# Altium project PCB_Project2.PrjPCB (part 1 of 2)
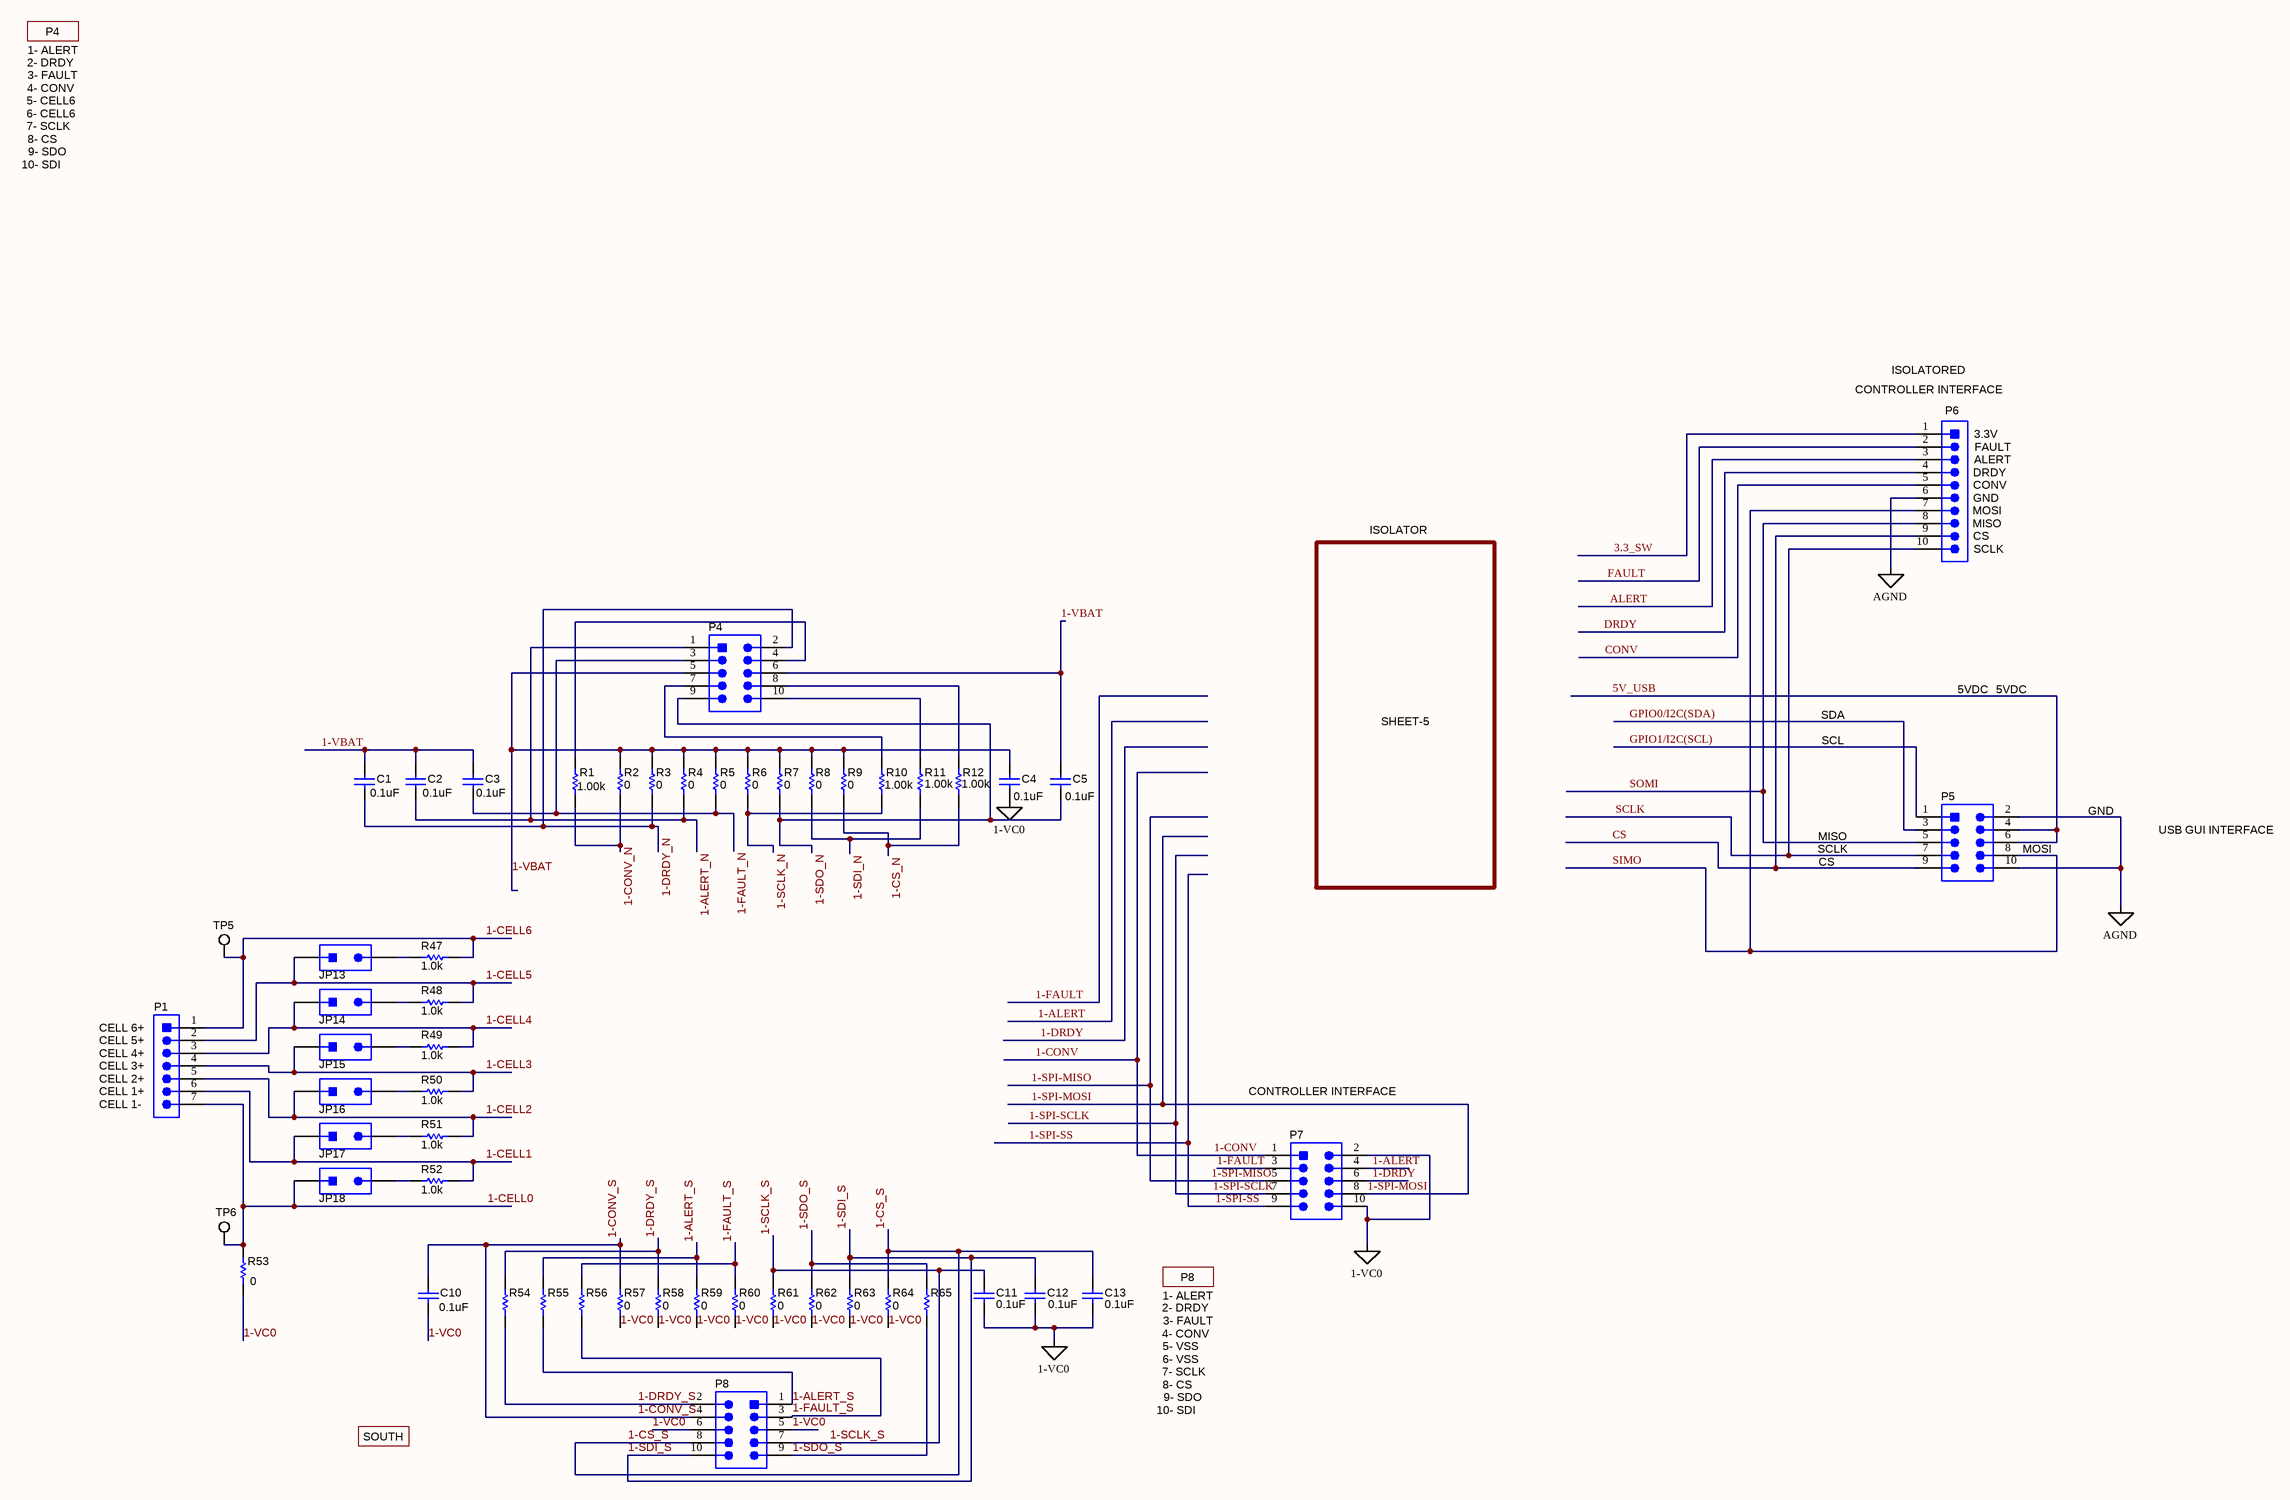
[diagram p0: Sheet1.SchDoc]
4 sheets, 255 parts. Net scope: global (net labels, ports and power ports of the same name join across sheets).
Board file: PCB2.PcbDoc
Sheets:
  Sheet1.SchDoc
  Sheet2.SchDoc
  Sheet5.SchDoc
  Sheet_hardware.SchDoc

## Sheet Sheet1.SchDoc
size A2

### Parts
C1  value 0.1uF  [0603[]]  (hidden comment: 06035C104KAT2A)
C2  value 0.1uF  [0603[]]  (hidden comment: 06035C104KAT2A)
C3  value 0.1uF  [0603[]]  (hidden comment: 06035C104KAT2A)
C4  value 0.1uF  [0603[]]  (hidden comment: 06035C104KAT2A)
C5  value 0.1uF  [0603[]]  (hidden comment: 06035C104KAT2A)
C10  value 0.1uF  [0603[]]  (hidden comment: 06035C104KAT2A)
C11  value 0.1uF  [0603[]]  (hidden comment: 06035C104KAT2A)
C12  value 0.1uF  [0603[]]  (hidden comment: 06035C104KAT2A)
C13  value 0.1uF  [0603[]]  (hidden comment: 06035C104KAT2A)
JP13  PEC02SAAN  [CONN_PEC02SAAN]  (value not drawn)
JP14  PEC02SAAN  [CONN_PEC02SAAN]  (value not drawn)
JP15  PEC02SAAN  [CONN_PEC02SAAN]  (value not drawn)
JP16  PEC02SAAN  [CONN_PEC02SAAN]  (value not drawn)
JP17  PEC02SAAN  [CONN_PEC02SAAN]  (value not drawn)
JP18  PEC02SAAN  [CONN_PEC02SAAN]  (value not drawn)
P1  395021007  [Molex_395021007]  (value not drawn)
P4  5103308-1  [CONN_5103308-1]  (value not drawn)
P5  5103308-1  [CONN_5103308-1]  (value not drawn)
P6  HPM-10-05-T-S  [Samtec_HPM-10-05-T-S]  (value not drawn)
P7  5103308-1  [CONN_5103308-1]  (value not drawn)
P8  5103308-1  [CONN_5103308-1]  (value not drawn)
R1  value 1.00k  [1206[]]  (hidden comment: CRCW12061K00FKEA)
R2  ValueDisplayed: 0  [0603[]]  (hidden comment: CRCW06030000Z0EA)
R3  ValueDisplayed: 0  [0603[]]  (hidden comment: CRCW06030000Z0EA)
R4  ValueDisplayed: 0  [0603[]]  (hidden comment: CRCW06030000Z0EA)
R5  ValueDisplayed: 0  [0603[]]  (hidden comment: CRCW06030000Z0EA)
R6  ValueDisplayed: 0  [0603[]]  (hidden comment: CRCW06030000Z0EA)
R7  ValueDisplayed: 0  [0603[]]  (hidden comment: CRCW06030000Z0EA)
R8  ValueDisplayed: 0  [0603[]]  (hidden comment: CRCW06030000Z0EA)
R9  ValueDisplayed: 0  [0603[]]  (hidden comment: CRCW06030000Z0EA)
R10  value 1.00k  [1206[]]  (hidden comment: CRCW12061K00FKEA)
R11  value 1.00k  [1206[]]  (hidden comment: CRCW12061K00FKEA)
R12  value 1.00k  [1206[]]  (hidden comment: CRCW12061K00FKEA)
R47  ValueDisplayed: 1.0k  [0603[]]  (hidden comment: CRCW06031K00JNEA)
R48  ValueDisplayed: 1.0k  [0603[]]  (hidden comment: CRCW06031K00JNEA)
R49  ValueDisplayed: 1.0k  [0603[]]  (hidden comment: CRCW06031K00JNEA)
R50  ValueDisplayed: 1.0k  [0603[]]  (hidden comment: CRCW06031K00JNEA)
R51  ValueDisplayed: 1.0k  [0603[]]  (hidden comment: CRCW06031K00JNEA)
R52  ValueDisplayed: 1.0k  [0603[]]  (hidden comment: CRCW06031K00JNEA)
R53  ValueDisplayed: 0  [1206[]]  (hidden comment: CRCW12060000Z0EA)
R54  CRCW12061K00FKEA  [1206[]]  (value not drawn)
R55  CRCW12061K00FKEA  [1206[]]  (value not drawn)
R56  CRCW12061K00FKEA  [1206[]]  (value not drawn)
R57  ValueDisplayed: 0  [0603[]]  (hidden comment: CRCW06031K00JNEA)
R58  ValueDisplayed: 0  [0603[]]  (hidden comment: CRCW06031K00JNEA)
R59  ValueDisplayed: 0  [0603[]]  (hidden comment: CRCW06031K00JNEA)
R60  ValueDisplayed: 0  [0603[]]  (hidden comment: CRCW06031K00JNEA)
R61  ValueDisplayed: 0  [0603[]]  (hidden comment: CRCW06031K00JNEA)
R62  ValueDisplayed: 0  [0603[]]  (hidden comment: CRCW06031K00JNEA)
R63  ValueDisplayed: 0  [0603[]]  (hidden comment: CRCW06031K00JNEA)
R64  ValueDisplayed: 0  [0603[]]  (hidden comment: CRCW06031K00JNEA)
R65  CRCW12061K00FKEA  [1206[]]  (value not drawn)
TP5  5015  [Testpoint_Keystone_Miniature]  (value not drawn)
TP6  5015  [Testpoint_Keystone_Miniature]  (value not drawn)

### Nets
1-CELL0: C4.2 C10.2 C11.2 C12.2 C13.2 JP18.1 P1.7 P7.2 P7.10 P8.5 P8.6 R53.1 R53.2 R57.1 R58.1 R59.1 R60.1 R61.1 R62.1 R63.1 R64.1 TP6.1  [also labelled 1-VC0]
AGND: P5.2 P5.10 P6.6
1-ALERT: P7.4
1-ALERT_N: C2.2 P4.1 R4.1
1-ALERT_S: P8.1 R55.1 R55.2 R59.2
1-CELL1: JP17.1 P1.6 R52.2
1-CELL2: JP16.1 P1.5 R51.2
1-CELL3: JP15.1 P1.4 R50.2
1-CELL4: JP14.1 P1.3 R49.2
1-CELL5: JP13.1 P1.2 R48.2
1-CELL6: P1.1 R47.2 TP5.1
1-CONV: P7.1
1-CONV_N: R1.1 R2.1
1-CONV_S: C10.1 P8.4 R57.2
1-CS_N: R9.1 R12.1
1-CS_S: C13.1 P8.8 R64.2
1-DRDY: P7.6
1-DRDY_N: C1.2 P4.2 R3.1
1-DRDY_S: P8.2 R54.1 R54.2 R58.2
1-FAULT: P7.3
1-FAULT_N: C3.2 P4.3 R5.1
1-FAULT_S: P8.3 R56.1 R56.2 R60.2
1-SCLK_N: R6.1 R10.1
1-SCLK_S: C11.1 P8.7 R61.2
1-SDI_N: R8.1 R11.1
1-SDI_S: C12.1 P8.10 R63.2
1-SDO_N: C5.2 P4.9 R7.1
1-SDO_S: P8.9 R62.2 R65.1 R65.2
1-SPI-MISO: P7.5
1-SPI-MOSI: P7.8
1-SPI-SCLK: P7.7
1-SPI-SS: P7.9
1-VBAT: C1.1 C2.1 C3.1 C4.1 C5.1 P4.5 P4.6 R2.2 R3.2 R4.2 R5.2 R6.2 R7.2 R8.2 R9.2
3.3_SW: P6.1
5V_USB: P5.4 P5.6
ALERT: P6.3
CONV: P6.5
CS: P5.9 P6.9
DRDY: P6.4
FAULT: P6.2
GPIO0/I2C(SDA): P5.3
GPIO1/I2C(SCL): P5.1
SCLK: P5.7 P6.10
SIMO: P5.8 P6.7
SOMI: P5.5 P6.8
NetJP13_2: JP13.2 R47.1
NetJP14_2: JP14.2 R48.1
NetJP15_2: JP15.2 R49.1
NetJP16_2: JP16.2 R50.1
NetJP17_2: JP17.2 R51.1
NetJP18_2: JP18.2 R52.1
NetP4_4: P4.4 R1.2
NetP4_7: P4.7 R10.2
NetP4_8: P4.8 R12.2
NetP4_10: P4.10 R11.2

### Notes on the sheet
- 2- DRDY
- 1- ALERT
- P4
- 7- SCLK
- 4- CONV
- 5- CELL6
- 6- CELL6
- 3- FAULT
- 10- SDI
- 8- CS
- 9- SDO
- ISOLATORED
- (near P6) CONTROLLER INTERFACE
- (near P6) 3.3V
- (near P6) FAULT
- (near P6) GND
- (near P6) DRDY
- (near P6) CONV
- (near P6) ALERT
- ISOLATOR
- (near P6) CS
- (near P6) MOSI
- (near P6) MISO
- (near P6) SCLK
- 5VDC
- SHEET-5
- SCL
- SDA
- GND
- USB GUI INTERFACE
- CS
- SCLK
- MISO
- (near P5) MOSI
- (near P1) CELL 2+
- (near P1) CELL 3+
- (near P1) CELL 4+
- (near P1) CELL 5+
- (near P1) CELL 6+
- (near P1) CELL 1-
- (near P1) CELL 1+
- CONTROLLER INTERFACE
- P8
- 5- VSS
- 6- VSS
- SOUTH

### Library data of the parts
C1-C5 C10-C13 = 06035C104KAT2A: CAP, CERM, 0.1 µF, 50 V, +/- 10%, X7R, 0603; Manufacturer: AVX; Polarized: N; CompType: Capacitor; ValueDisplayed: 0.1µF; U/M: EA; Cap_F: 0.0000001; Tolerance_%: 10; Value1: Unknown; VDC_V: 50; Value2: 50V; TaMin_C: -55; TaMax_C: 125; Cap_Case: 0603; SymbolVersion: 2008-07-09; PartNumber: 06035C104KAT2A; PackageReference: 0603; RoHS: Y; MountType: SMT; Technology: Ceramic; TempCo: X7R; Published: 2008-06-19; Publisher: Texas Instruments; LatestRevisionDate: 2015-07-09; ComponentLink1Description: Datasheet link; ComponentLink1URL: http://www.avx.com/docs/Catalogs/cx7r.pdf; Supplier 1: Digi-Key; Supplier Part Number 1: 478-5052-1-ND; Supplier 2: Mouser; Supplier Part Number 2: 581-06035C104KAT2A; Supplier 3: Farnell; Supplier Part Number 3: 1301804
JP13-JP18 = PEC02SAAN: Header, 100mil, 2x1, Tin, TH; Manufacturer: Sullins Connector Solutions; SymbolCreator: a0412235; U/M: EA; SymbolVersion: 2013-10-31; PartNumber: PEC02SAAN; ClassName: Header; PackageReference: Header, 2 PIN, 100mil, Tin; CompType: Header; RoHS: Y; MountType: TH; ComponentLink1Description: Datasheet Link; ComponentLink1URL: http://www.sullinscorp.com/catalogs/97_Page78-79_HEADER_.100_2.54mm_MALE_BREAKAWAY.pdf; Publisher: Texas Instruments; LatestRevisionDate: 2014-11-19; Supplier 1: Digi-Key; Supplier Part Number 1: S1012E-02-ND
P1 = 395021007: Header(Shrouded), 3.5mm, 7x1,  R/A, TH; Manufacturer: Molex; SymbolCreator: a0411947; U/M: EA; SymbolVersion: 2013-12-22; PartNumber: 395021007; PackageReference: Header(Shrouded), 3.5mm, 7x1, R/A, TH; CompType: Header; RoHS: Y; MountType: TH; ComponentLink1Description: Datasheet Link; ComponentLink1URL: http://www.molex.com/pdm_docs/sd/395021002_sd.pdf; Publisher: Texas Instruments; LatestRevisionDate: 2015-06-30; Supplier 1: Digi-Key; Supplier Part Number 1: WM7775-ND; Supplier 2: Mouser; Supplier Part Number 2: 538-39502-1007
P4 P5 P7 P8 = 5103308-1: Header (shrouded), 100mil, 5x2, Gold, TH; Manufacturer: TE Connectivity; SymbolCreator: a0412235; U/M: EA; SymbolVersion: 2013-12-22; PartNumber: 5103308-1; PackageReference: 5x2 Shrouded header; CompType: Header; RoHS: Y; MountType: TH; ComponentLink1Description: Datasheet Link; ComponentLink1URL: http://www.te.com/commerce/DocumentDelivery/DDEController?Action=showdoc&DocId=Customer+Drawing%7F5103308%7FE%7Fpdf%7FEnglish%7FENG_CD_5103308_E.pdf%7F5103308-1; Publisher: Texas Instruments; LatestRevisionDate: 2014-11-19; Supplier 1: Digi-Key; Supplier Part Number 1: A33159-ND; Supplier 2: Mouser; Supplier Part Number 2: 571-5103308-1; Supplier 3: Farnell; Supplier Part Number 3: 1772835
P6 = HPM-10-05-T-S: Header, 5.08mm, 10x1, Tin, TH; Manufacturer: Samtec; SymbolCreator: a0412235; U/M: EA; SymbolVersion: 2013-12-22; PartNumber: HPM-10-05-T-S; PackageReference: Header, 5.08mm, 10x1, TH; ClassName: Header; CompType: Header; RoHS: Y; MountType: TH; ComponentLink1Description: Datasheet Link; ComponentLink1URL: https://www.samtec.com/ftppub/pdf/HPM.PDF; Publisher: Texas Instruments; LatestRevisionDate: 2015-08-24; Supplier 1: Digi-Key; Supplier Part Number 1: HPM-10-05-T-S-ND
R1 R10-R12 = CRCW12061K00FKEA: RES, 1.00 k, 1%, 0.25 W, 1206; Manufacturer: Vishay-Dale; CompType: Resistor; Res_ohm: 1000; Value_Code: 1k00; Tolerance_%: 1; Power_W: 0.25; Value2: 0.25W; VDC_V: 200; TempCo: 100 ppm/C; EIA_Code: E96; U/M: EA; SymbolVersion: 2009-05-29; PartNumber: CRCW12061K00FKEA; PackageReference: 1206; RoHS: Y; Value1: 1%; MountType: SMT; Technology: Thick Film; Published: 2008-06-26; Publisher: Texas Instruments; LatestRevisionDate: 2015-06-11; ComponentLink1Description: Datasheet link; ComponentLink1URL: http://www.vishay.com/docs/20035/dcrcwe3.pdf; Supplier 1: Digi-Key; Supplier Part Number 1: 541-1.00KFCT-ND; Supplier 2: Mouser; Supplier Part Number 2: 71-CRCW1206-1.0K-E3; Supplier 3: Farnell; Supplier Part Number 3: 1469965; ValueDisplayed: 1.00k
R2-R9 = CRCW06030000Z0EA: RES, 0, 5%, 0.1 W, 0603; Manufacturer: Vishay-Dale; CompType: Resistor; Value: 0; Value_Code: 0000; Tolerance_%: 5; Power_W: 0.1; Value2: 0.1W; VDC_V: 75; TempCo: 200 ppm/C; EIA_Code: E24; U/M: EA; SymbolVersion: 2009-05-29; PartNumber: CRCW06030000Z0EA; PackageReference: 0603; RoHS: Y; Res_ohm: 0; Value1: 5%; MountType: SMT; Technology: Thick Film; Published: 2008-06-26; Publisher: Texas Instruments; LatestRevisionDate: 2015-06-13; ComponentLink1Description: Datasheet link; ComponentLink1URL: http://www.vishay.com/docs/20035/dcrcwe3.pdf; Supplier 1: Digi-Key; Supplier Part Number 1: 541-0.0GCT-ND; Supplier 2: Mouser; Supplier Part Number 2: 71-CRCW0603-0-E3; Supplier 3: Farnell; Supplier Part Number 3: 1469739
R47-R52 R57-R64 = CRCW06031K00JNEA: RES, 1.0 k, 5%, 0.1 W, 0603; Manufacturer: Vishay-Dale; CompType: Resistor; Value: 1.0k; Res_ohm: 1000; Value_Code: 1k00; Tolerance_%: 5; Power_W: 0.1; Value2: 0.1W; VDC_V: 75; TempCo: 200 ppm/C; EIA_Code: E24; U/M: EA; SymbolVersion: 2009-05-29; PartNumber: CRCW06031K00JNEA; PackageReference: 0603; RoHS: Y; Value1: 5%; MountType: SMT; Technology: Thick Film; Published: 2008-06-26; Publisher: Texas Instruments; LatestRevisionDate: 2015-06-13; ComponentLink1Description: Datasheet link; ComponentLink1URL: http://www.vishay.com/docs/20035/dcrcwe3.pdf; Supplier 1: Digi-Key; Supplier Part Number 1: 541-1.0KGCT-ND; Supplier 2: Mouser; Supplier Part Number 2: 71-CRCW0603J-1.0K-E3; Supplier 3: Farnell; Supplier Part Number 3: 1652851
R53 = CRCW12060000Z0EA: RES, 0, 5%, 0.25 W, 1206; Manufacturer: Vishay-Dale; CompType: Resistor; Value: 0; Value_Code: 0000; Tolerance_%: 5; Power_W: 0.25; Value2: 0.25W; VDC_V: 200; TempCo: 200 ppm/C; EIA_Code: E24; U/M: EA; SymbolVersion: 2009-05-29; PartNumber: CRCW12060000Z0EA; PackageReference: 1206; RoHS: Y; Res_ohm: 0; Value1: 5%; MountType: SMT; Technology: Thick Film; Published: 2008-06-26; Publisher: Texas Instruments; LatestRevisionDate: 2015-06-11; ComponentLink1Description: Datasheet link; ComponentLink1URL: http://www.vishay.com/docs/20035/dcrcwe3.pdf; Supplier 1: Digi-Key; Supplier Part Number 1: 541-0.0ECT-ND; Supplier 2: Mouser; Supplier Part Number 2: 71-CRCW1206-0-E3; Supplier 3: Farnell; Supplier Part Number 3: 1469963
R54-R56 R65 = CRCW12061K00FKEA: RES, 1.00 k, 1%, 0.25 W, 1206; Manufacturer: Vishay-Dale; CompType: Resistor; Value: 1.00k; Res_ohm: 1000; Value_Code: 1k00; Tolerance_%: 1; Power_W: 0.25; Value2: 0.25W; VDC_V: 200; TempCo: 100 ppm/C; EIA_Code: E96; U/M: EA; SymbolVersion: 2009-05-29; PartNumber: CRCW12061K00FKEA; PackageReference: 1206; RoHS: Y; Value1: 1%; MountType: SMT; Technology: Thick Film; Published: 2008-06-26; Publisher: Texas Instruments; LatestRevisionDate: 2015-06-11; ComponentLink1Description: Datasheet link; ComponentLink1URL: http://www.vishay.com/docs/20035/dcrcwe3.pdf; Supplier 1: Digi-Key; Supplier Part Number 1: 541-1.00KFCT-ND; Supplier 2: Mouser; Supplier Part Number 2: 71-CRCW1206-1.0K-E3; Supplier 3: Farnell; Supplier Part Number 3: 1469965; ValueDisplayed: 1.00k
TP5 TP6 = 5015: Test Point, Miniature, SMT; Manufacturer: Keystone; CompType: Test Point Loop; U/M: EA; SymbolVersion: 2008-07-10; PackageReference: Testpoint_Keystone_Miniature; Publisher: Texas Instruments; LatestRevisionDate: 2015-07-28; PartNumber: 5015; RoHS: Y; MountType: SMT; ComponentLink1Description: Datasheet Link; ComponentLink1URL: http://www.keyelco.com/userAssets/store/files/5015.PDF; Value: SMT; Supplier 1: Digi-Key; Supplier Part Number 1: 36-5015CT-ND

## Sheet Sheet2.SchDoc
size A2
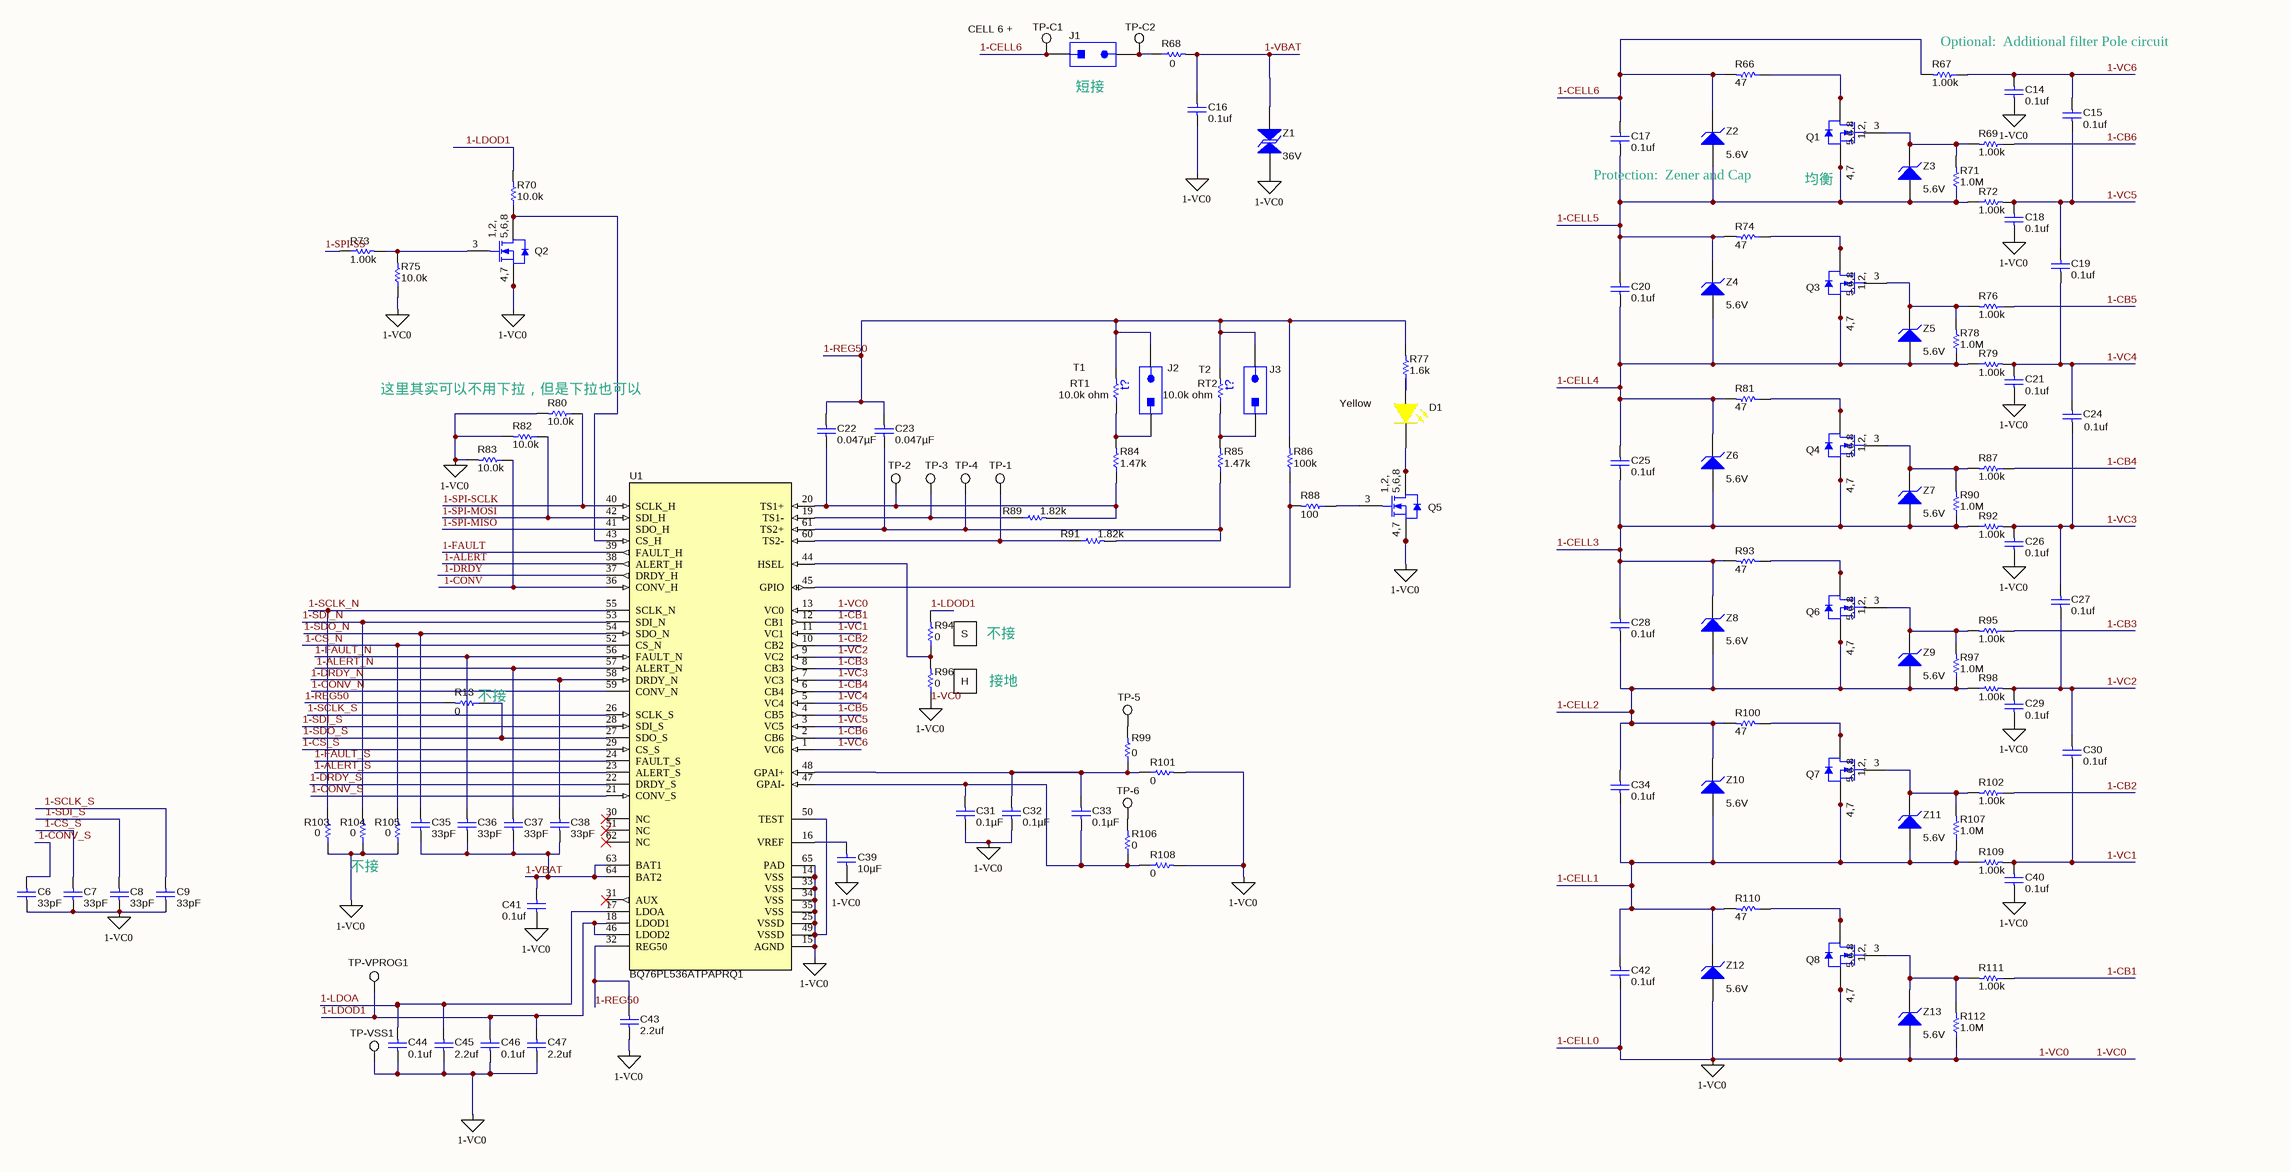
[diagram p1: Sheet2.SchDoc]

### Parts
C6  ValueDisplayed: 33pF  [0603[]]  (hidden comment: GRM1885C1H330JA01D)
C7  ValueDisplayed: 33pF  [0603[]]  (hidden comment: GRM1885C1H330JA01D)
C8  ValueDisplayed: 33pF  [0603[]]  (hidden comment: GRM1885C1H330JA01D)
C9  ValueDisplayed: 33pF  [0603[]]  (hidden comment: GRM1885C1H330JA01D)
C14  ValueDisplayed: 0.1uf  [0603[]]  (hidden comment: 06035C104KAT2A)
C15  ValueDisplayed: 0.1uf  [0603[]]  (hidden comment: GRM188R72A104KA35D)
C16  ValueDisplayed: 0.1uf  [0603[]]  (hidden comment: GRM188R72A104KA35D)
C17  ValueDisplayed: 0.1uf  [0603[]]  (hidden comment: 06035C104KAT2A)
C18  ValueDisplayed: 0.1uf  [0603[]]  (hidden comment: 06035C104KAT2A)
C19  ValueDisplayed: 0.1uf  [0603[]]  (hidden comment: GRM188R72A104KA35D)
C20  ValueDisplayed: 0.1uf  [0603[]]  (hidden comment: 06035C104KAT2A)
C21  ValueDisplayed: 0.1uf  [0603[]]  (hidden comment: 06035C104KAT2A)
C22  ValueDisplayed: 0.047µF  [0603[]]  (hidden comment: GRM188R71C473KA01D)
C23  ValueDisplayed: 0.047µF  [0603[]]  (hidden comment: GRM188R71C473KA01D)
C24  ValueDisplayed: 0.1uf  [0603[]]  (hidden comment: GRM188R72A104KA35D)
C25  ValueDisplayed: 0.1uf  [0603[]]  (hidden comment: 06035C104KAT2A)
C26  ValueDisplayed: 0.1uf  [0603[]]  (hidden comment: 06035C104KAT2A)
C27  ValueDisplayed: 0.1uf  [0603[]]  (hidden comment: GRM188R72A104KA35D)
C28  ValueDisplayed: 0.1uf  [0603[]]  (hidden comment: 06035C104KAT2A)
C29  ValueDisplayed: 0.1uf  [0603[]]  (hidden comment: 06035C104KAT2A)
C30  ValueDisplayed: 0.1uf  [0603[]]  (hidden comment: GRM188R72A104KA35D)
C31  ValueDisplayed: 0.1µF  [0603[]]  (hidden comment: C0603C104K4RACTU)
C32  ValueDisplayed: 0.1µF  [0603[]]  (hidden comment: C0603C104K4RACTU)
C33  ValueDisplayed: 0.1µF  [0603[]]  (hidden comment: C0603C104K4RACTU)
C34  ValueDisplayed: 0.1uf  [0603[]]  (hidden comment: GRM188R72A104KA35D)
C35  ValueDisplayed: 33pF  [0603[]]  (hidden comment: GRM1885C1H330JA01D)
C36  ValueDisplayed: 33pF  [0603[]]  (hidden comment: GRM1885C1H330JA01D)
C37  ValueDisplayed: 33pF  [0603[]]  (hidden comment: GRM1885C1H330JA01D)
C38  ValueDisplayed: 33pF  [0603[]]  (hidden comment: GRM1885C1H330JA01D)
C39  ValueDisplayed: 10µF  [0805_145]  (hidden comment: C2012X7R1A106M125AC)
C40  ValueDisplayed: 0.1uf  [0603[]]  (hidden comment: 06035C104KAT2A)
C41  ValueDisplayed: 0.1uf  [0603[]]  (hidden comment: 06035C104KAT2A)
C42  ValueDisplayed: 0.1uf  [0603[]]  (hidden comment: 06035C104KAT2A)
C43  ValueDisplayed: 2.2uf  [0805_HV]  (hidden comment: GRM21BR71A225KA01L)
C44  ValueDisplayed: 0.1uf  [0603[]]  (hidden comment: 06035C104KAT2A)
C45  ValueDisplayed: 2.2uf  [0805_HV]  (hidden comment: GRM21BR71A225KA01L)
C46  ValueDisplayed: 0.1uf  [0603[]]  (hidden comment: 06035C104KAT2A)
C47  ValueDisplayed: 2.2uf  [0805_HV]  (hidden comment: GRM21BR71A225KA01L)
D1  value Yellow  [APT1608_Yellow]  (hidden comment: APT1608SYCK)
J1  PEC02SAAN  [CONN_PEC02SAAN]  (value not drawn)
J2  PEC02SAAN  [CONN_PEC02SAAN]  (value not drawn)
J3  PEC02SAAN  [CONN_PEC02SAAN]  (value not drawn)
Q1  CSD16301Q2  [TRANS_NexFET_Q2]  (value not drawn)
Q2  CSD16301Q2  [TRANS_NexFET_Q2]  (value not drawn)
Q3  CSD16301Q2  [TRANS_NexFET_Q2]  (value not drawn)
Q4  CSD16301Q2  [TRANS_NexFET_Q2]  (value not drawn)
Q5  CSD16301Q2  [TRANS_NexFET_Q2]  (value not drawn)
Q6  CSD16301Q2  [TRANS_NexFET_Q2]  (value not drawn)
Q7  CSD16301Q2  [TRANS_NexFET_Q2]  (value not drawn)
Q8  CSD16301Q2  [TRANS_NexFET_Q2]  (value not drawn)
R13  ValueDisplayed: 0  [0603[]]  (hidden comment: CRCW06030000Z0EA)
R66  ValueDisplayed: 47  [2512]  (hidden comment: CRCW251247R0JNEG)
R67  ValueDisplayed: 1.00k  [0603[]]  (hidden comment: RG1608P-102-B-T5)
R68  ValueDisplayed: 0  [0805_HV]  (hidden comment: CRCW08050000Z0EA)
R69  ValueDisplayed: 1.00k  [0603[]]  (hidden comment: RG1608P-102-B-T5)
R70  ValueDisplayed: 10.0k  [0603[]]  (hidden comment: ERJ-3EKF1002V)
R71  ValueDisplayed: 1.0M  [0603[]]  (hidden comment: CRCW06031M00JNEA)
R72  ValueDisplayed: 1.00k  [0603[]]  (hidden comment: RG1608P-102-B-T5)
R73  ValueDisplayed: 1.00k  [0603[]]  (hidden comment: RG1608P-102-B-T5)
R74  ValueDisplayed: 47  [2512]  (hidden comment: CRCW251247R0JNEG)
R75  ValueDisplayed: 10.0k  [0603[]]  (hidden comment: ERJ-3EKF1002V)
R76  ValueDisplayed: 1.00k  [0603[]]  (hidden comment: RG1608P-102-B-T5)
R77  ValueDisplayed: 1.6k  [0603[]]  (hidden comment: CRCW06031K60JNEA)
R78  ValueDisplayed: 1.0M  [0603[]]  (hidden comment: CRCW06031M00JNEA)
R79  ValueDisplayed: 1.00k  [0603[]]  (hidden comment: RG1608P-102-B-T5)
R80  ValueDisplayed: 10.0k  [0603[]]  (hidden comment: ERJ-3EKF1002V)
R81  ValueDisplayed: 47  [2512]  (hidden comment: CRCW251247R0JNEG)
R82  ValueDisplayed: 10.0k  [0603[]]  (hidden comment: ERJ-3EKF1002V)
R83  ValueDisplayed: 10.0k  [0603[]]  (hidden comment: ERJ-3EKF1002V)
R84  ValueDisplayed: 1.47k  [0603[]]  (hidden comment: CRCW06031K47FKEA)
R85  ValueDisplayed: 1.47k  [0603[]]  (hidden comment: CRCW06031K47FKEA)
R86  ValueDisplayed: 100k  [0603[]]  (hidden comment: CRCW0603100KFKEA)
R87  ValueDisplayed: 1.00k  [0603[]]  (hidden comment: RG1608P-102-B-T5)
R88  ValueDisplayed: 100  [0603[]]  (hidden comment: CRCW0603100RJNEA)
R89  ValueDisplayed: 1.82k  [0603[]]  (hidden comment: CRCW06031K82FKEA)
R90  ValueDisplayed: 1.0M  [0603[]]  (hidden comment: CRCW06031M00JNEA)
R91  ValueDisplayed: 1.82k  [0603[]]  (hidden comment: CRCW06031K82FKEA)
R92  ValueDisplayed: 1.00k  [0603[]]  (hidden comment: RG1608P-102-B-T5)
R93  ValueDisplayed: 47  [2512]  (hidden comment: CRCW251247R0JNEG)
R94  ValueDisplayed: 0  [0603[]]  (hidden comment: CRCW06030000Z0EA)
R95  ValueDisplayed: 1.00k  [0603[]]  (hidden comment: RG1608P-102-B-T5)
R96  ValueDisplayed: 0  [0603[]]  (hidden comment: CRCW06030000Z0EA)
R97  ValueDisplayed: 1.0M  [0603[]]  (hidden comment: CRCW06031M00JNEA)
R98  ValueDisplayed: 1.00k  [0603[]]  (hidden comment: RG1608P-102-B-T5)
R99  ValueDisplayed: 0  [0603[]]  (hidden comment: CRCW06030000Z0EA)
R100  ValueDisplayed: 47  [2512]  (hidden comment: CRCW251247R0JNEG)
R101  ValueDisplayed: 0  [0603[]]  (hidden comment: CRCW06030000Z0EA)
R102  ValueDisplayed: 1.00k  [0603[]]  (hidden comment: RG1608P-102-B-T5)
R103  ValueDisplayed: 0  [0603[]]  (hidden comment: CRCW06030000Z0EA)
R104  ValueDisplayed: 0  [0603[]]  (hidden comment: CRCW06030000Z0EA)
R105  ValueDisplayed: 0  [0603[]]  (hidden comment: CRCW06030000Z0EA)
R106  ValueDisplayed: 0  [0603[]]  (hidden comment: CRCW06030000Z0EA)
R107  ValueDisplayed: 1.0M  [0603[]]  (hidden comment: CRCW06031M00JNEA)
R108  ValueDisplayed: 0  [0603[]]  (hidden comment: CRCW06030000Z0EA)
R109  ValueDisplayed: 1.00k  [0603[]]  (hidden comment: RG1608P-102-B-T5)
R110  ValueDisplayed: 47  [2512]  (hidden comment: CRCW251247R0JNEG)
R111  ValueDisplayed: 1.00k  [0603[]]  (hidden comment: RG1608P-102-B-T5)
R112  ValueDisplayed: 1.0M  [0603[]]  (hidden comment: CRCW06031M00JNEA)
RT1  value 10.0k ohm  [0603[]]  (hidden comment: ERT-J1VG103FA)
RT2  value 10.0k ohm  [0603[]]  (hidden comment: ERT-J1VG103FA)
TP-1  5015  [Testpoint_Keystone_Miniature]  (value not drawn)
TP-2  5015  [Testpoint_Keystone_Miniature]  (value not drawn)
TP-3  5015  [Testpoint_Keystone_Miniature]  (value not drawn)
TP-4  5015  [Testpoint_Keystone_Miniature]  (value not drawn)
TP-5  5015  [Testpoint_Keystone_Miniature]  (value not drawn)
TP-6  5015  [Testpoint_Keystone_Miniature]  (value not drawn)
TP-C1  5015  [Testpoint_Keystone_Miniature]  (value not drawn)
TP-C2  5015  [Testpoint_Keystone_Miniature]  (value not drawn)
TP-VPROG1  5015  [Testpoint_Keystone_Miniature]  (value not drawn)
TP-VSS1  5015  [Testpoint_Keystone_Miniature]  (value not drawn)
U1  BQ76PL536ATPAPRQ1  [PAP0064F_N]
Z1  value 36V  [SMA]  (hidden comment: SMAJ36CA)
Z2  value 5.6V  [SOD-123]  (hidden comment: MMSZ5232B-7-F)
Z3  value 5.6V  [SOD-123]  (hidden comment: MMSZ5232B-7-F)
Z4  value 5.6V  [SOD-123]  (hidden comment: MMSZ5232B-7-F)
Z5  value 5.6V  [SOD-123]  (hidden comment: MMSZ5232B-7-F)
Z6  value 5.6V  [SOD-123]  (hidden comment: MMSZ5232B-7-F)
Z7  value 5.6V  [SOD-123]  (hidden comment: MMSZ5232B-7-F)
Z8  value 5.6V  [SOD-123]  (hidden comment: MMSZ5232B-7-F)
Z9  value 5.6V  [SOD-123]  (hidden comment: MMSZ5232B-7-F)
Z10  value 5.6V  [SOD-123]  (hidden comment: MMSZ5232B-7-F)
Z11  value 5.6V  [SOD-123]  (hidden comment: MMSZ5232B-7-F)
Z12  value 5.6V  [SOD-123]  (hidden comment: MMSZ5232B-7-F)
Z13  value 5.6V  [SOD-123]  (hidden comment: MMSZ5232B-7-F)

### Nets
1-CELL0: C6.2 C7.2 C8.2 C9.2 C14.2 C16.2 C18.2 C21.2 C26.2 C29.2 C31.2 C32.2 C39.2 C40.2 C41.2 C42.2 C43.2 C44.2 C45.2 C46.2 C47.2 Q2.4(S) Q2.7(S) Q5.4(S) Q5.7(S) Q8.4(S) Q8.7(S) R75.1 R80.2 R82.2 R83.2 R96.1 R101.2 R103.1 R104.1 R105.1 R108.2 R112.1 TP-VSS1.1 U1.13(VC0) U1.14(VSS) U1.15(AGND) U1.25(VSSD) U1.33(VSS) U1.34(VSS) U1.35(VSS) U1.49(VSSD) U1.50(TEST) U1.65(PAD) Z1.1 Z12.2(A) Z13.2(A)  [also labelled 1-VC0]
1-ALERT: U1.38(ALERT_H)
1-ALERT_N: C37.1 U1.57(ALERT_N)
1-ALERT_S: U1.23(ALERT_S)
1-CB1: R111.1 U1.12(CB1)
1-CB2: R102.1 U1.10(CB2)
1-CB3: R95.1 U1.8(CB3)
1-CB4: R87.1 U1.6(CB4)
1-CB5: R76.1 U1.4(CB5)
1-CB6: R69.1 U1.2(CB6)
1-CELL1: C34.2 C42.1 Q7.4(S) Q7.7(S) R107.1 R109.1 R110.2 Z10.2(A) Z11.2(A) Z12.1(K)
1-CELL2: C28.2 C34.1 Q6.4(S) Q6.7(S) R97.1 R98.1 R100.2 Z8.2(A) Z9.2(A) Z10.1(K)
1-CELL3: C25.2 C28.1 Q4.4(S) Q4.7(S) R90.1 R92.1 R93.2 Z6.2(A) Z7.2(A) Z8.1(K)
1-CELL4: C20.2 C25.1 Q3.4(S) Q3.7(S) R78.1 R79.1 R81.2 Z4.2(A) Z5.2(A) Z6.1(K)
1-CELL5: C17.2 C20.1 Q1.4(S) Q1.7(S) R71.1 R72.1 R74.2 Z2.2(A) Z3.2(A) Z4.1(K)
1-CELL6: C17.1 J1.1 R66.2 R67.2 TP-C1.1 Z2.1(K)
1-CONV: R83.1 U1.36(CONV_H)
1-CONV_N: U1.59(CONV_N)
1-CONV_S: C6.1 U1.21(CONV_S)
1-CS_N: R105.2 U1.52(CS_N)
1-CS_S: C7.1 U1.29(CS_S)
1-DRDY: U1.37(DRDY_H)
1-DRDY_N: C38.1 U1.58(DRDY_N)
1-DRDY_S: U1.22(DRDY_S)
1-FAULT: U1.39(FAULT_H)
1-FAULT_N: C36.1 U1.56(FAULT_N)
1-FAULT_S: U1.24(FAULT_S)
1-LDOA: C44.1 C45.1 U1.17(LDOA)
1-LDOD1: C46.1 C47.1 R70.2 R94.2 TP-VPROG1.1 U1.18(LDOD1) U1.46(LDOD2)
1-REG50: C22.1 C23.1 C43.1 J2.2 J3.2 R13.2 R77.2 R86.2 RT1.2 RT2.2 U1.32(REG50)
1-SCLK_N: R103.2 U1.55(SCLK_N)
1-SCLK_S: C9.1 U1.26(SCLK_S)
1-SDI_N: R104.2 U1.53(SDI_N)
1-SDI_S: C8.1 U1.28(SDI_S)
1-SDO_N: C35.1 U1.54(SDO_N)
1-SDO_S: R13.1 U1.27(SDO_S)
1-SPI-MISO: U1.41(SDO_H)
1-SPI-MOSI: R82.1 U1.42(SDI_H)
1-SPI-SCLK: R80.1 U1.40(SCLK_H)
1-SPI-SS: R73.1
1-VBAT: C16.1 C35.2 C36.2 C37.2 C38.2 C41.1 R68.2 U1.63(BAT1) U1.64(BAT2) Z1.2
1-VC1: C30.2 C40.1 R109.2 U1.11(VC1)
1-VC2: C27.2 C29.1 C30.1 R98.2 U1.9(VC2)
1-VC3: C24.2 C26.1 C27.1 R92.2 U1.7(VC3)
1-VC4: C19.2 C21.1 C24.1 R79.2 U1.5(VC4)
1-VC5: C15.2 C18.1 C19.1 R72.2 U1.3(VC5)
1-VC6: C14.1 C15.1 R67.1 U1.1(VC6)
NetC22_2: C22.2 R84.1 R89.2 TP-2.1 U1.20(TS1+)
NetC23_2: C23.2 R85.1 R91.2 TP-4.1 U1.61(TS2+)
NetC31_1: C31.1 C33.2 R106.1 R108.1 U1.47(GPAI-)
NetC32_1: C32.1 C33.1 R99.1 R101.1 U1.48(GPAI+)
NetC39_1: C39.1 U1.16(VREF)
NetD1_1: D1.1(A) R77.1
NetD1_2: D1.2(K) Q5.1(D) Q5.2(D) Q5.5(D) Q5.6(D) Q5.8(D)
NetJ1_2: J1.2 R68.1 TP-C2.1
NetJ2_1: J2.1 R84.2 RT1.1
NetJ3_1: J3.1 R85.2 RT2.1
NetQ1_1: Q1.1(D) Q1.2(D) Q1.5(D) Q1.6(D) Q1.8(D) R66.1
NetQ1_3: Q1.3(G) R69.2 R71.2 Z3.1(K)
NetQ2_1: Q2.1(D) Q2.2(D) Q2.5(D) Q2.6(D) Q2.8(D) R70.1 U1.43(CS_H)
NetQ2_3: Q2.3(G) R73.2 R75.2
NetQ3_1: Q3.1(D) Q3.2(D) Q3.5(D) Q3.6(D) Q3.8(D) R74.1
NetQ3_3: Q3.3(G) R76.2 R78.2 Z5.1(K)
NetQ4_1: Q4.1(D) Q4.2(D) Q4.5(D) Q4.6(D) Q4.8(D) R81.1
NetQ4_3: Q4.3(G) R87.2 R90.2 Z7.1(K)
NetQ5_3: Q5.3(G) R88.1
NetQ6_1: Q6.1(D) Q6.2(D) Q6.5(D) Q6.6(D) Q6.8(D) R93.1
NetQ6_3: Q6.3(G) R95.2 R97.2 Z9.1(K)
NetQ7_1: Q7.1(D) Q7.2(D) Q7.5(D) Q7.6(D) Q7.8(D) R100.1
NetQ7_3: Q7.3(G) R102.2 R107.2 Z11.1(K)
NetQ8_1: Q8.1(D) Q8.2(D) Q8.5(D) Q8.6(D) Q8.8(D) R110.1
NetQ8_3: Q8.3(G) R111.2 R112.2 Z13.1(K)
NetR86_1: R86.1 R88.2 U1.45(GPIO)
NetR89_1: R89.1 TP-3.1 U1.19(TS1-)
NetR91_1: R91.1 TP-1.1 U1.60(TS2-)
NetR94_1: R94.1 R96.2 U1.44(HSEL)
NetR99_2: R99.2 TP-5.1
NetR106_2: R106.2 TP-6.1

Not connected (* = marked no-connect by the designer): U1 30(NC)* 31(AUX)* 51(NC)* 62(NC)*

### Notes on the sheet
- (near TP-C1) CELL 6 +
- Optional:  Additional filter Pole circuit
- (near J1) 短接
- Protection:  Zener and Cap
- (near Q1) 均衡
- 这里其实可以不用下拉，但是下拉也可以
- (near RT1) T1
- (near RT2) T2
- S
- H
- 不接
- 接地
- (near R13) 不接
- (in symbol CSD16301Q2) 1,2,; 5,6,8; 4,7
- (in symbol ERT-J1VG103FA) t?

### Library data of the parts
C6-C9 C35-C38 = GRM1885C1H330JA01D: CAP, CERM, 33 pF, 50 V, +/- 5%, C0G/NP0, 0603; Manufacturer: MuRata; Polarized: N; CompType: Capacitor; Value: 33pF; U/M: EA; Cap_F: 0.000000000033; Tolerance_%: 5; Value1: Unknown; VDC_V: 50; Value2: 50V; TaMin_C: -55; TaMax_C: 125; Cap_Case: 0603; SymbolVersion: 2008-07-09; PartNumber: GRM1885C1H330JA01D; PackageReference: 0603; RoHS: Y; MountType: SMT; Technology: Ceramic; TempCo: C0G/NP0; Published: 2008-06-19; Publisher: Texas Instruments; LatestRevisionDate: 2015-07-09; ComponentLink1Description: Datasheet link; ComponentLink1URL: http://search.murata.co.jp/Ceramy/PnsearchViewAction.do?HnOFG=ON&HnNFG=ON&SEL_CNT=50&sLang=en&sKey=GRM1885C1H330JA01D&x=9&y=9&search=startwith; Supplier 1: Digi-Key; Supplier Part Number 1: 490-1415-1-ND; Supplier 2: Mouser; Supplier Part Number 2: 81-GRM39C330J50; Supplier 3: Farnell; Supplier Part Number 3: 1828910
C14 C17 C18 C20 C21 C25 C26 C28 C29 C40-C42 C44 C46 = 06035C104KAT2A: CAP, CERM, 0.1uf, 50 V, +/- 10%, X7R, 0603; Manufacturer: AVX; Polarized: N; CompType: Capacitor; U/M: EA; Cap_F: 0.0000001; Tolerance_%: 10; Value1: Unknown; VDC_V: 50; Value2: 50V; TaMin_C: -55; TaMax_C: 125; Cap_Case: 0603; SymbolVersion: 2008-07-09; Value: 0.1uF; PartNumber: 06035C104KAT2A; PackageReference: 0603; RoHS: Y; MountType: SMT; Technology: Ceramic; TempCo: X7R; Published: 2008-06-19; Publisher: Texas Instruments; LatestRevisionDate: 2015-07-09; ComponentLink1Description: Datasheet link; ComponentLink1URL: http://www.avx.com/docs/Catalogs/cx7r.pdf; Supplier 1: Digi-Key; Supplier Part Number 1: 478-5052-1-ND; Supplier 2: Mouser; Supplier Part Number 2: 581-06035C104KAT2A; Supplier 3: Farnell; Supplier Part Number 3: 1301804
C15 C16 C19 C24 C27 C30 C34 = GRM188R72A104KA35D: CAP, CERM, 0.1uf, 100 V, +/- 10%, X7R, 0603; Manufacturer: MuRata; Polarized: N; CompType: Capacitor; U/M: EA; Cap_F: 0.0000001; Tolerance_%: 10; Value1: Unknown; VDC_V: 100; Value2: 100V; TaMin_C: -55; TaMax_C: 125; Cap_Case: 0603; SymbolVersion: 2008-07-09; Value: 0.1uF; PartNumber: GRM188R72A104KA35D; PackageReference: 0603; RoHS: Y; MountType: SMT; Technology: Ceramic; TempCo: X7R; Published: 2008-06-19; Publisher: Texas Instruments; LatestRevisionDate: 2015-07-09; ComponentLink1Description: Datasheet link; ComponentLink1URL: http://search.murata.co.jp/Ceramy/PnsearchViewAction.do?HnOFG=ON&HnNFG=ON&SEL_CNT=50&sLang=en&sKey=GRM188R72A104KA35D&x=9&y=9&search=startwith; Supplier 1: Digi-Key; Supplier Part Number 1: 490-3285-1-ND; Supplier 2: Mouser; Supplier Part Number 2: 81-GRM188R72A104KA35; Supplier 3: Farnell; Supplier Part Number 3: 1828921
C22 C23 = GRM188R71C473KA01D: CAP, CERM, 0.047 µF, 16 V, +/- 10%, X7R, 0603; Manufacturer: MuRata; Polarized: N; CompType: Capacitor; Value: 0.047uF; U/M: EA; Cap_F: 0.000000047; Tolerance_%: 10; Value1: Unknown; VDC_V: 16; Value2: 16V; TaMin_C: -55; TaMax_C: 125; Cap_Case: 0603; SymbolVersion: 2008-07-09; PartNumber: GRM188R71C473KA01D; PackageReference: 0603; RoHS: Y; MountType: SMT; Technology: Ceramic; TempCo: X7R; Published: 2008-06-19; Publisher: Texas Instruments; LatestRevisionDate: 2015-07-09; ComponentLink1Description: Datasheet link; ComponentLink1URL: http://search.murata.co.jp/Ceramy/PnsearchViewAction.do?HnOFG=ON&HnNFG=ON&SEL_CNT=50&sLang=en&sKey=GRM188R71C473KA01D&x=9&y=9&search=startwith; Supplier 1: Digi-Key; Supplier Part Number 1: 490-1529-1-ND; Supplier 2: Mouser; Supplier Part Number 2: 81-GRM39X473K16D
C31-C33 = C0603C104K4RACTU: CAP, CERM, 0.1 µF, 16 V, +/- 10%, X7R, 0603; Manufacturer: Kemet; Polarized: N; CompType: Capacitor; Value: 0.1uF; U/M: EA; Cap_F: 0.0000001; Tolerance_%: 10; Value1: Unknown; VDC_V: 16; Value2: 16V; TaMin_C: -55; TaMax_C: 125; Cap_Case: 0603; SymbolVersion: 2008-07-09; PartNumber: C0603C104K4RACTU; PackageReference: 0603; RoHS: Y; MountType: SMT; Technology: Ceramic; TempCo: X7R; Published: 2008-06-19; Publisher: Texas Instruments; LatestRevisionDate: 2015-07-09; ComponentLink1Description: Datasheet link; ComponentLink1URL: http://www.kemet.com/kemet/web/homepage/kechome.nsf/vapubfiles/F3102_Y5V.pdf/$file/F3102_Y5V.pdf; Supplier 1: Digi-Key; Supplier Part Number 1: 399-1096-1-ND; Supplier 2: Mouser; Supplier Part Number 2: 80-C0603C104K4R; Supplier 3: Farnell; Supplier Part Number 3: 1414610
C39 = C2012X7R1A106M125AC: CAP, CERM, 10 µF, 10 V, +/- 20%, X7R, 0805; Manufacturer: TDK; Polarized: N; CompType: Capacitor; Value: 10uF; U/M: EA; Cap_F: 0.00001; Tolerance_%: 20; Value1: Unknown; VDC_V: 10; Value2: 10V; TaMin_C: -55; TaMax_C: 125; Cap_Case: 0805; SymbolVersion: 2008-07-09; PartNumber: C2012X7R1A106M125AC; PackageReference: 0805; RoHS: Y; MountType: SMT; Technology: Ceramic; TempCo: X7R; Published: 2008-06-19; Publisher: Texas Instruments; LatestRevisionDate: 2015-07-09; ComponentLink1Description: Datasheet link; ComponentLink1URL: http://product.tdk.com/capacitor/mlcc/en/documents/mlcc_commercial_general_en.pdf; Supplier 1: Digi-Key; Supplier Part Number 1: 445-7592-1-ND; Supplier 2: Mouser; Supplier Part Number 2: 810-C2012X7R1A106M; Supplier 3: Farnell; Supplier Part Number 3: 2354122
C43 C45 C47 = GRM21BR71A225KA01L: CAP, CERM, 2.2 µF, 10 V, +/- 10%, X7R, 0805; Manufacturer: MuRata; Polarized: N; CompType: Capacitor; Value: 2.2uF; U/M: EA; Cap_F: 0.0000022; Tolerance_%: 10; ESR_ohm: 0.006; Value1: 0.006 ohm; Value2: 10V; TaMin_C: -55; TaMax_C: 125; Cap_Case: 0805; SymbolVersion: 2008-07-09; PartNumber: GRM21BR71A225KA01L; PackageReference: 0805; RoHS: Y; VDC_V: 10; MountType: SMT; Technology: Ceramic; TempCo: X7R; Published: 2008-06-19; Publisher: Texas Instruments; LatestRevisionDate: 2015-07-09; ComponentLink1Description: Datasheet link; ComponentLink1URL: http://search.murata.co.jp/Ceramy/PnsearchViewAction.do?HnOFG=ON&HnNFG=ON&SEL_CNT=50&sLang=en&sKey=GRM21BR71A225KA01L&x=9&y=9&search=startwith; Supplier 1: Digi-Key; Supplier Part Number 1: 490-1696-1-ND; Supplier 2: Mouser; Supplier Part Number 2: 81-GRM21BR71A225KA01; Supplier 3: Farnell; Supplier Part Number 3: 1828923
D1 = APT1608SYCK: LED, Yellow, SMD; Manufacturer: Kingbright; SymbolCreator: Altium; Vf_V: 2.5; Value2: 2.5V; Io_A: 0.02; Vr_V: 5; Ir_A: 1e-005; Tjmax_C: 85; Value1: W; Angle: 120; U/M: EA; SymbolVersion: 2015-06-04; PartNumber: APT1608SYCK; PackageReference: 0603(1608); RoHS: Y; CompType: LED; Type: ?; MountType: SMT; Color: yellow; Published: 2008-07-11; Publisher: Texas Instruments; ComponentLink1URL: http://www.kingbrightusa.com/images/catalog/SPEC/APT1608SYCK.pdf; ComponentLink1Description: Datasheet link; LatestRevisionDate: 2015-06-25; Supplier 1: Digi-Key; Supplier Part Number 1: 754-1124-1-ND; Supplier 2: Mouser; Supplier Part Number 2: 604-APT1608SYCK
J1-J3 = PEC02SAAN: as JP13 on sheet Sheet1; SymbolVersion: 2013-10-31; PartNumber: PEC02SAAN; ClassName: Header; PackageReference: Header, 2 PIN, 100mil, Tin; CompType: Header; RoHS: Y; MountType: TH; ComponentLink1Description: Datasheet Link; ComponentLink1URL: http://www.sullinscorp.com/catalogs/97_Page78-79_HEADER_.100_2.54mm_MALE_BREAKAWAY.pdf; Publisher: Texas Instruments; LatestRevisionDate: 2014-11-19; Supplier 1: Digi-Key; Supplier Part Number 1: S1012E-02-ND
Q1-Q8 = CSD16301Q2: MOSFET, N-CH, 25 V, 5 A, SON 2x2mm; Manufacturer: Texas Instruments; Alternate Manufacturer: None; U/M: EA; ChType: N; Value: 25V; VdsMax_V: 25; Value1: 0.023 ohm; Rdson45_ohm: 0.023; Value2: 2 nC; QgTyp_nC: 2; Vgs_V: 10; IdsMax_A: 5; SymbolVersion: 2011-11-14; CompType: MOSFET; PartNumber: CSD16301Q2; PackageReference: SON 2x2mm; RoHS: Y; MountType: SMT; Published: 2008-06-19; Publisher: Texas Instruments; LatestRevisionDate: 2015-08-03; LatestRevisionNote: Added parts.; ComponentLink1Description: Datasheet link; ComponentLink1URL: http://www.ti.com/lit/ds/symlink/csd16301q2.pdf; Supplier 1: Digi-Key; Supplier Part Number 1: 296-25260-1-ND; Supplier 2: Mouser; Supplier Part Number 2: 595-CSD16301Q2; Supplier 3: Farnell; Supplier Part Number 3: 1854243
R13 R94 R96 R99 R101 R103-R106 R108 = CRCW06030000Z0EA: as R2 on sheet Sheet1; SymbolVersion: 2009-05-29; PartNumber: CRCW06030000Z0EA; PackageReference: 0603; RoHS: Y; Res_ohm: 0; Value1: 5%; MountType: SMT; Technology: Thick Film; Published: 2008-06-26; Publisher: Texas Instruments; LatestRevisionDate: 2015-06-13; ComponentLink1Description: Datasheet link; ComponentLink1URL: http://www.vishay.com/docs/20035/dcrcwe3.pdf; Supplier 1: Digi-Key; Supplier Part Number 1: 541-0.0GCT-ND; Supplier 2: Mouser; Supplier Part Number 2: 71-CRCW0603-0-E3; Supplier 3: Farnell; Supplier Part Number 3: 1469739
R66 R74 R81 R93 R100 R110 = CRCW251247R0JNEG: RES, 47, 5%, 1 W, 2512; Manufacturer: Vishay-Dale; CompType: Resistor; Value: 47; Value_Code: 47R0; Tolerance_%: 5; Power_W: 1; Value2: 1W; VDC_V: 500; TempCo: 200 ppm/C; EIA_Code: E24; U/M: EA; SymbolVersion: 2009-05-29; PartNumber: CRCW251247R0JNEG; PackageReference: 2512; RoHS: Y; Res_ohm: 47; Value1: 5%; MountType: SMT; Technology: Thick Film; Published: 2008-06-26; Publisher: Texas Instruments; LatestRevisionDate: 2015-04-21; ComponentLink1Description: Datasheet link; ComponentLink1URL: http://www.vishay.com/doc?20035; Supplier 1: Digi-Key; Supplier Part Number 1: 541-47XCT-ND
R67 R69 R72 R73 R76 R79 R87 R92 R95 R98 R102 R109 R111 = RG1608P-102-B-T5: RES, 1.00 k, 0.1%, 0.1 W, 0603; Manufacturer: Susumu Co Ltd; CompType: Resistor; Value: 1.00k; Res_ohm: 1000; Value_Code: 1k00; Tolerance_%: 0.1; Value2: 0.1W; VDC_V: 75; TempCo: 25 ppm/C; EIA_Code: E192; U/M: EA; SymbolVersion: 2009-05-29; PartNumber: RG1608P-102-B-T5; PackageReference: 0603; RoHS: Y; Value1: 0.1%; Power_W: 0.1; MountType: SMT; Technology: Metal Film; Published: 2008-06-26; Publisher: Texas Instruments; LatestRevisionDate: 2015-06-13; ComponentLink1Description: Datasheet link; ComponentLink1URL: http://www.susumu.co.jp/english/pdf/products-j01-01.pdf; Supplier 1: Digi-Key; Supplier Part Number 1: RG16P1.0KBCT-ND; Supplier 2: Mouser; Supplier Part Number 2: 754-RG1608P-102-B-T5; Supplier 3: Farnell; Supplier Part Number 3: 1797076
R68 = CRCW08050000Z0EA: RES, 0, 5%, 0.125 W, 0805; Manufacturer: Vishay-Dale; CompType: Resistor; Value: 0; Value_Code: 0000; Tolerance_%: 5; Power_W: 0.125; Value2: 0.125W; VDC_V: 150; TempCo: 200 ppm/C; EIA_Code: E24; U/M: EA; SymbolVersion: 2009-05-29; PartNumber: CRCW08050000Z0EA; PackageReference: 0805; RoHS: Y; Res_ohm: 0; Value1: 5%; MountType: SMT; Technology: Thick Film; Published: 2008-06-26; Publisher: Texas Instruments; LatestRevisionDate: 2015-07-07; ComponentLink1Description: Datasheet link; ComponentLink1URL: http://www.vishay.com/docs/20035/dcrcwe3.pdf; Supplier 1: Digi-Key; Supplier Part Number 1: 541-0.0ACT-ND; Supplier 2: Mouser; Supplier Part Number 2: 71-CRCW0805-0-E3; Supplier 3: Farnell; Supplier Part Number 3: 1469846
R70 R75 R80 R82 R83 = ERJ-3EKF1002V: RES, 10.0 k, 1%, 0.1 W, 0603; Manufacturer: Panasonic; CompType: Resistor; Value: 10.0k; Res_ohm: 10000; Value_Code: 10k0; Tolerance_%: 1; Power_W: 0.1; Value2: 0.1W; VDC_V: 75; TempCo: 100 ppm/C; EIA_Code: E96; U/M: EA; SymbolVersion: 2009-05-29; PartNumber: ERJ-3EKF1002V; PackageReference: 0603; RoHS: Y; Value1: 1%; MountType: SMT; Technology: Thick Film; Published: 2008-06-26; Publisher: Texas Instruments; LatestRevisionDate: 2015-06-13; ComponentLink1Description: Datasheet link; ComponentLink1URL: http://industrial.panasonic.com/www-data/pdf/AOA0000/AOA0000CE2.pdf; Supplier 1: Digi-Key; Supplier Part Number 1: P10.0KHCT-ND; Supplier 2: Mouser; Supplier Part Number 2: 667-ERJ-3EKF1002V; Supplier 3: Farnell; Supplier Part Number 3: 2397737
R71 R78 R90 R97 R107 R112 = CRCW06031M00JNEA: RES, 1.0 M, 5%, 0.1 W, 0603; Manufacturer: Vishay-Dale; CompType: Resistor; Value: 1.0Meg; Res_ohm: 1000000; Value_Code: 1M00; Tolerance_%: 5; Power_W: 0.1; Value2: 0.1W; VDC_V: 75; TempCo: 200 ppm/C; EIA_Code: E24; U/M: EA; SymbolVersion: 2009-05-29; PartNumber: CRCW06031M00JNEA; PackageReference: 0603; RoHS: Y; Value1: 5%; MountType: SMT; Technology: Thick Film; Published: 2008-06-26; Publisher: Texas Instruments; LatestRevisionDate: 2015-06-13; ComponentLink1Description: Datasheet link; ComponentLink1URL: http://www.vishay.com/docs/20035/dcrcwe3.pdf; Supplier 1: Digi-Key; Supplier Part Number 1: 541-1.0MGCT-ND; Supplier 2: Mouser; Supplier Part Number 2: 71-CRCW0603J-1.0M-E3; Supplier 3: Farnell; Supplier Part Number 3: 1514706
R77 = CRCW06031K60JNEA: RES, 1.6 k, 5%, 0.1 W, 0603; Manufacturer: Vishay-Dale; CompType: Resistor; Value: 1.6k; Res_ohm: 1600; Value_Code: 1k60; Tolerance_%: 5; Power_W: 0.1; Value2: 0.1W; VDC_V: 75; TempCo: 200 ppm/C; EIA_Code: E24; U/M: EA; SymbolVersion: 2009-05-29; PartNumber: CRCW06031K60JNEA; PackageReference: 0603; RoHS: Y; Value1: 5%; MountType: SMT; Technology: Thick Film; Published: 2008-06-26; Publisher: Texas Instruments; LatestRevisionDate: 2015-06-13; ComponentLink1Description: Datasheet link; ComponentLink1URL: http://www.vishay.com/docs/20035/dcrcwe3.pdf; Supplier 1: Digi-Key; Supplier Part Number 1: 541-1.6KGCT-ND; Supplier 2: Mouser; Supplier Part Number 2: 71-CRCW0603J-1.6K-E3; Supplier 3: Farnell; Supplier Part Number 3: 1541949
R84 R85 = CRCW06031K47FKEA: RES, 1.47 k, 1%, 0.1 W, 0603; Manufacturer: Vishay-Dale; CompType: Resistor; Value: 1.47k; Res_ohm: 1470; Value_Code: 1k47; Tolerance_%: 1; Power_W: 0.1; Value2: 0.1W; VDC_V: 75; TempCo: 100 ppm/C; EIA_Code: E96; U/M: EA; SymbolVersion: 2009-05-29; PartNumber: CRCW06031K47FKEA; PackageReference: 0603; RoHS: Y; Value1: 1%; MountType: SMT; Technology: Thick Film; Published: 2008-06-26; Publisher: Texas Instruments; LatestRevisionDate: 2015-06-13; ComponentLink1Description: Datasheet link; ComponentLink1URL: http://www.vishay.com/docs/20035/dcrcwe3.pdf; Supplier 1: Digi-Key; Supplier Part Number 1: 541-1.47KHCT-ND; Supplier 2: Mouser; Supplier Part Number 2: 71-CRCW0603-1.47K-E3; Supplier 3: Farnell; Supplier Part Number 3: 1563607
R86 = CRCW0603100KFKEA: RES, 100 k, 1%, 0.1 W, 0603; Manufacturer: Vishay-Dale; CompType: Resistor; Value: 100k; Res_ohm: 100000; Tolerance_%: 1; Power_W: 0.1; Value2: 0.1W; VDC_V: 75; TempCo: 100 ppm/C; EIA_Code: E96; U/M: EA; SymbolVersion: 2009-05-29; PartNumber: CRCW0603100KFKEA; PackageReference: 0603; RoHS: Y; Value_Code: 100k; Value1: 1%; MountType: SMT; Technology: Thick Film; Published: 2008-06-26; Publisher: Texas Instruments; LatestRevisionDate: 2015-06-13; ComponentLink1Description: Datasheet link; ComponentLink1URL: http://www.vishay.com/docs/20035/dcrcwe3.pdf; Supplier 1: Digi-Key; Supplier Part Number 1: 541-100KHCT-ND; Supplier 2: Mouser; Supplier Part Number 2: 71-CRCW0603-100K-E3; Supplier 3: Farnell; Supplier Part Number 3: 1469649
R88 = CRCW0603100RJNEA: RES, 100, 5%, 0.1 W, 0603; Manufacturer: Vishay-Dale; CompType: Resistor; Value: 100; Value_Code: 100R; Tolerance_%: 5; Power_W: 0.1; Value2: 0.1W; VDC_V: 75; TempCo: 200 ppm/C; EIA_Code: E24; U/M: EA; SymbolVersion: 2009-05-29; PartNumber: CRCW0603100RJNEA; PackageReference: 0603; RoHS: Y; Res_ohm: 100; Value1: 5%; MountType: SMT; Technology: Thick Film; Published: 2008-06-26; Publisher: Texas Instruments; LatestRevisionDate: 2015-06-13; ComponentLink1Description: Datasheet link; ComponentLink1URL: http://www.vishay.com/docs/20035/dcrcwe3.pdf; Supplier 1: Digi-Key; Supplier Part Number 1: 541-100GCT-ND; Supplier 2: Mouser; Supplier Part Number 2: 71-CRCW0603J-100-E3; Supplier 3: Farnell; Supplier Part Number 3: 1514715
R89 R91 = CRCW06031K82FKEA: RES, 1.82 k, 1%, 0.1 W, 0603; Manufacturer: Vishay-Dale; CompType: Resistor; Value: 1.82k; Res_ohm: 1820; Value_Code: 1k82; Tolerance_%: 1; Power_W: 0.1; Value2: 0.1W; VDC_V: 75; TempCo: 100 ppm/C; EIA_Code: E96; U/M: EA; SymbolVersion: 2009-05-29; PartNumber: CRCW06031K82FKEA; PackageReference: 0603; RoHS: Y; Value1: 1%; MountType: SMT; Technology: Thick Film; Published: 2008-06-26; Publisher: Texas Instruments; LatestRevisionDate: 2015-06-13; ComponentLink1Description: Datasheet link; ComponentLink1URL: http://www.vishay.com/docs/20035/dcrcwe3.pdf; Supplier 1: Digi-Key; Supplier Part Number 1: 541-1.82KHCT-ND; Supplier 2: Mouser; Supplier Part Number 2: 71-CRCW0603-1.82K-E3; Supplier 3: Farnell; Supplier Part Number 3: 1652855
RT1 RT2 = ERT-J1VG103FA: Thermistor NTC, 10.0k ohm, 1%, 0603; Manufacturer: Panasonic; Tolerance_%: 1; Power_W: 0.1; TaMin_C: -40; TaMax_C: 125; U/M: EA; CompType: ThermistorNTC; SymbolVersion: 2008-11-25; PartNumber: ERT-J1VG103FA; Series: ERT-J; PackageReference: 0603; MountType: SMT; RoHS: Y; ComponentLink1Description: Datasheet link; ComponentLink1URL: http://industrial.panasonic.com/www-data/pdf/AUA0000/AUA0000CE1.pdf; Published: 2009-09-22; Publisher: Texas Instruments; LatestRevisionDate: 2015-06-10; Supplier 1: Digi-Key; Supplier Part Number 1: P12011CT-ND
TP-1-TP-6 TP-C1 TP-C2 TP-VPROG1 TP-VSS1 = 5015: as TP5 on sheet Sheet1; SymbolVersion: 2008-07-10; PackageReference: Testpoint_Keystone_Miniature; Publisher: Texas Instruments; LatestRevisionDate: 2015-07-28; PartNumber: 5015; RoHS: Y; MountType: SMT; ComponentLink1Description: Datasheet Link; ComponentLink1URL: http://www.keyelco.com/userAssets/store/files/5015.PDF; Value: SMT; Supplier 1: Digi-Key; Supplier Part Number 1: 36-5015CT-ND
U1 = BQ76PL536ATPAPRQ1: 3 to 6 Series Cell Lithium-Ion Battery Monitor and Secondary Protection IC for EV and HEV Application, PAP0064F; Alternate PartNumber: BQ76PL536ATPAPTQ1; Manufacturer: Texas Instruments; SymbolCreator: Altium; U/M: EA; SymbolVersion: 2015-11-04; PartNumber: BQ76PL536ATPAPRQ1; PackageReference: PAP0064F; MountType: SMT; ComponentLink1Description: Datasheet Link; ComponentLink1URL: http://www.ti.com/lit/ds/symlink/bq76pl536a.pdf; CompType: IC; RoHS: Y; Publisher: Texas Instruments; LatestRevisionDate: 2015-11-04; Alternate Manufacturer: Texas Instruments
Z1 = SMAJ36CA: Diode, TVS, Bi, 36 V, 400 W, SMA; Manufacturer: Littelfuse; U/M: EA; Power_W: 400; Vr_V: 36; Value1: 400W; RJA_CperW: 120; CompType: TVS; SymbolVersion: 2012-01-13; PartNumber: SMAJ36CA; PackageReference: SMA; Vz_V: N/A; MountType: SMT; RoHS: Y; ComponentLink1Description: Datasheet link; ComponentLink1URL: http://www.littelfuse.com/~/media/electronics/datasheets/tvs_diodes/littelfuse_tvs_diode_smaj_datasheet.pdf.pdf; Published: 2008-10-08; Publisher: Texas Instruments; LatestRevisionDate: 2015-07-08; LatestRevisionNote: Updated Supplier Data; Supplier 1: Digi-Key; Supplier Part Number 1: SMAJ36CALFDKR-ND; Supplier 2: Mouser; Supplier Part Number 2: 576-SMAJ36CA; Supplier 3: Farnell; Supplier Part Number 3: 1677588
Z2-Z13 = MMSZ5232B-7-F: Diode, Zener, 5.6 V, 500 mW, SOD-123; Manufacturer: Diodes Inc.; SymbolCreator: a0412235; U/M: EA; Power_W: 0.5; Vz_V: 5.6; Value1: 0.5W; RJA_CperW: 350; AEC Category: Q101; SymbolVersion: 2010-08-25; PartNumber: MMSZ5232B-7-F; PackageReference: SOD-123; CompType: Zener; Vr_V: N/A; MountType: SMT; RoHS: Y; ComponentLink1Description: Datasheet link; ComponentLink1URL: http://www.diodes.com/datasheets/ds18010.pdf; Published: 2008-10-08; Publisher: Texas Instruments; LatestRevisionDate: 2015-08-17; LatestRevisionNote: Updated Supplier Data; Supplier 1: Digi-Key; Supplier Part Number 1: MMSZ5232B-FDICT-ND; Supplier 2: Mouser; Supplier Part Number 2: 621-MMSZ5232B-F; Supplier 3: Farnell; Supplier Part Number 3: 2061469; AEC Qualified: ?